# Altium schematic sheet Output.SchDoc
size A; SheetNumber: 5; SheetTotal: 12
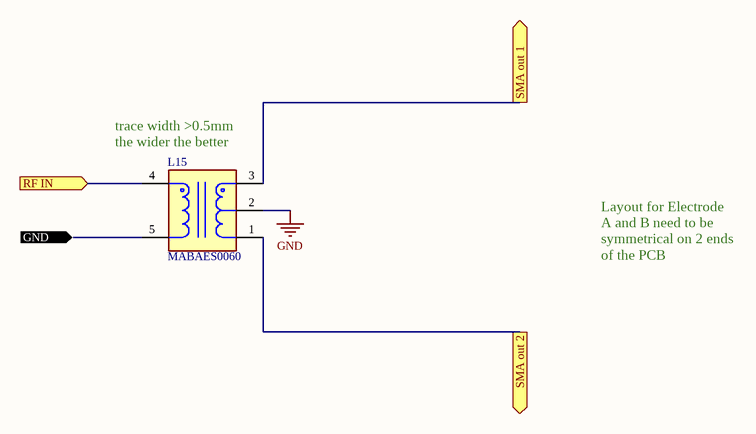
[diagram p0: Output.SchDoc]

## Parts
L15  MABAES0060  [FP-MABAES0060-MFG]

## Ports
GND (in), RF IN (in), SMA out 1 (out), SMA out 2 (out)

## Nets
GND: L15.2(Secondary_CT)
GND: L15.5(Primary) ; port GND  [a separate net that carries the same name]
RF IN: L15.4(Primary_dot) ; port RF IN
SMA out 1: L15.3(Secondary_Dot) ; port SMA out 1
SMA out 2: L15.1(Secondary) ; port SMA out 2

## Notes on the sheet
- (near L15) trace width >0.5mm the wider the better
- Layout for Electrode A and B need to be symmetrical on 2 ends of the PCB

## Library data of the parts
L15 = CMP-97513-000003-1: BALUN 300KHZ-200MHZ 1:1 6SMD; Insertion Loss: 1.5dB; Lead/Base Style: Gull Wing; Max DC Current: 500mA; Power Rating: 500mW; Package Quantity: 2000; Lead Free: Lead Free; Case/Package: SMD/SMT; Number of Pins: 5; Width: 3.81mm; Turns Ratio: 1:1; Depth: 3.81mm; Height: 2.67mm; Min Operating Temperature: -40°C; Termination: SMD/SMT; Length: 3.81mm; Max Operating Temperature: 85°C; Packaging: Tape and Reel; Radiation Hardening: No; Mount: Surface Mount